# Altium schematic sheet push-button-switch-12.SchDoc
size A4; SheetNumber: 12; SheetTotal: 17
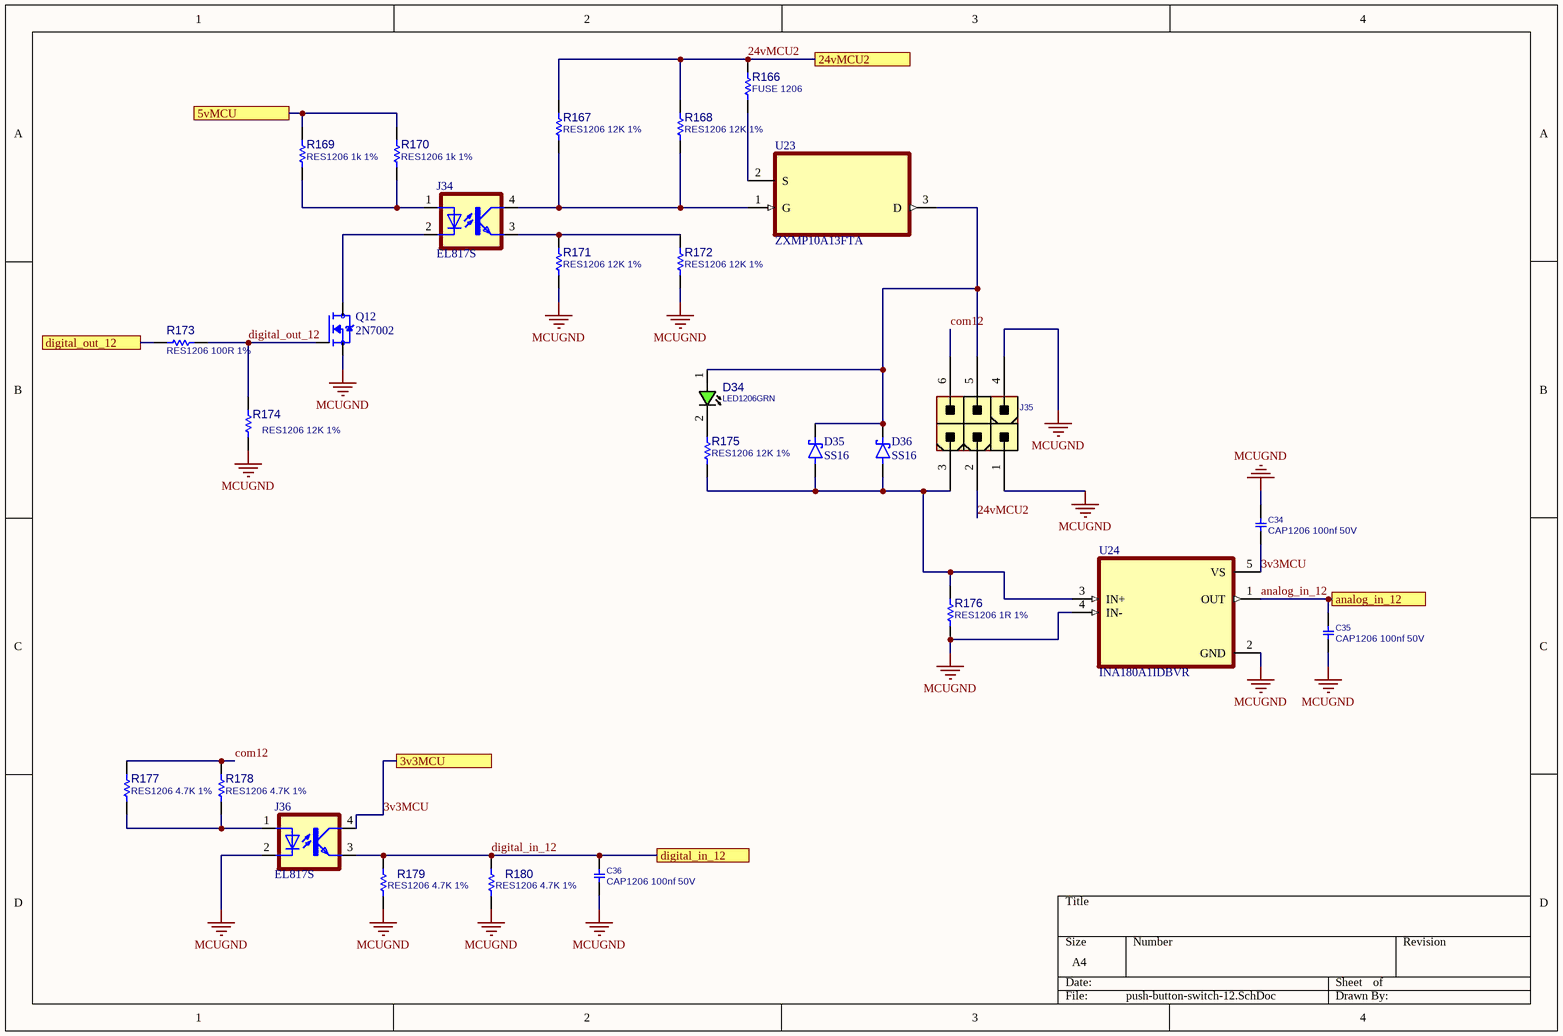
[diagram p0: push-button-switch-12.SchDoc]

## Parts
C34  CAP1206 100nf 50V  [C1206]
C35  CAP1206 100nf 50V  [C1206]
C36  CAP1206 100nf 50V  [C1206]
D34  LED1206GRN  [LED1206GRN]
D35  SS16  [DIOM4325X250N]
D36  SS16  [DIOM4325X250N]
J34  EL817S  [SOIC254P1030X460-4N]
J35  CONN_ATXPWR_6  [ATXPWR_6]  (value not drawn)
J36  EL817S  [SOIC254P1030X460-4N]
Q12  2N7002  [SOT95P240X111-3N]
R166  FUSE 1206  [R1206]
R167  RES1206 12K 1%  [R1206]
R168  RES1206 12K 1%  [R1206]
R169  RES1206 1k 1%  [R1206]
R170  RES1206 1k 1%  [R1206]
R171  RES1206 12K 1%  [R1206]
R172  RES1206 12K 1%  [R1206]
R173  RES1206 100R 1%  [R1206]
R174  RES1206 12K 1%  [R1206]
R175  RES1206 12K 1%  [R1206]
R176  RES1206 1R 1%  [R1206]
R177  RES1206 4.7K 1%  [R1206]
R178  RES1206 4.7K 1%  [R1206]
R179  RES1206 4.7K 1%  [R1206]
R180  RES1206 4.7K 1%  [R1206]
U23  ZXMP10A13FTA  [SOT95P230X110-3N]
U24  INA180A1IDBVR  [SOT95P280X145-5N]

## Ports
3v3MCU, 5vMCU, 24vMCU2, analog_in_12, digital_in_12, digital_out_12

## Nets
MCUGND: C34.1 C35.2 C36.2 J35.1 J35.4 J36.2(C) Q12.2(S) R171.2 R172.2 R174.2 R176.2 R179.1 R180.1 U24.2(GND) U24.4(IN-)
3v3MCU: C34.2 J36.4(COL) U24.5(VS) ; port 3v3MCU
5vMCU: R169.2 R170.2 ; port 5vMCU
24vMCU2: J35.2 R166.1 R167.1 R168.1 ; port 24vMCU2
analog_in_12: C35.1 U24.1(OUT) ; port analog_in_12
com12: J35.6 R177.2 R178.2
digital_in_12: C36.1 J36.3(EMIT) R179.2 R180.2 ; port digital_in_12
digital_out_12: Q12.1(G) R173.2 R174.1
digital_out_12: R173.1 ; port digital_out_12  [a separate net that carries the same name]
NetD34_1: D34.1(ANODE) D35.C(K) D36.C(K) J35.5 U23.3(D)
NetD34_2: D34.2(CATHODE) R175.1
NetD35_A: D35.A D36.A J35.3 R175.2 R176.1 U24.3(IN+)
NetJ34_1: J34.1(A) R169.1 R170.1
NetJ34_2: J34.2(C) Q12.3(D)
NetJ34_3: J34.3(EMIT) R171.1 R172.1
NetJ34_4: J34.4(COL) R167.2 R168.2 U23.1(G)
NetJ36_1: J36.1(A) R177.1 R178.1
NetR166_2: R166.2 U23.2(S)

## Library data of the parts
C34-C36 = CAP_SMD_MLCC_1206: CAP, MLCC; PARAM: -, -%; MANF_P#: MANF_PART#; PARAM2: -V; PRICE: 100= 1$; MANF: -; ASSEMBLY: ASSEMBLY
D34 = LED_SMD_1206_GRN: LED, SMD, 1206, GREEN; PARAM: 20mA; DESC: DESCRIPTION; PARAM2: 2.2V; MANF: -; ASSEMBLY: ASSEMBLY; PRICE: 36t@Javan; MANF_P#: -; VALUE: LED1206GRN; MountType: SMT; PartType: LED
D35 D36 = SS14: 1A, 40V, Schottky Rectifier; MF: Taiwan Semiconductor; SnapEDA_Link: https://www.snapeda.com/parts/SS14/taiwan/view-part/?ref=snap; Package: SMA-2 Taiwan Semiconductor; Value: *; MP: SS14; Check_prices: https://www.snapeda.com/parts/SS14/taiwan/view-part/?ref=eda
J34 J36 = EL817S: Optoisolator Transistor Output 5000Vrms 1 Channel 4-SMD; MF: Everlight Electronics; SnapEDA_Link: https://www.snapeda.com/parts/EL817S/Everlight+Electronics+Co+Ltd/view-part/?ref=snap; Package: SMD-4 Everlight Electronics Co Ltd; Value: *; MP: EL817S; Check_prices: https://www.snapeda.com/parts/EL817S/Everlight+Electronics+Co+Ltd/view-part/?ref=eda
J35 = CONN_ATXPWR_6: CONN, ATX POWER, 6 P; MANF: TE; MANF_P#: 4-1775099-1; VALUE: CONN_ATXPWR_6; MountType: THD; PACKAGE: ATXPWR-6pin; Part Type: Conn.
Q12 = 2N7002: N-Channel 60V 280mA (Ta) 350mW (Ta) Surface Mount SOT-23-3 (TO-236); MF: {'manufacturer': u'onsemi'}; Package: None; Price: None; Value: *; MP: 2N7002; Availability: Unavailable
R166-R180 = RES_SMD_1206: RESISTOR, SMD; PARAM: 1%, 0.25W; DESC: DESCRIPTION; DIST#: MOUSER; MANF_P#: -; MANF: -; ASSEMBLY: ASSEMBLY; PRICE: -; PARAM2: -
U23 = ZXMP10A13FTA: P-Channel 100 V 600mA (Ta) 625mW (Ta) Surface Mount SOT-23-3; MF: Diodes Inc.; Purchase-URL: https://pricing.snapeda.com/search/part/ZXMP10A13FTA/?ref=eda; Package: SOT-23-3 Diodes Inc.; SnapEDA_Link: https://www.snapeda.com/parts/ZXMP10A13FTA/Diodes+Inc./view-part/?ref=snap; Availability: In Stock; Value: *; MP: ZXMP10A13FTA; Check_prices: https://www.snapeda.com/parts/ZXMP10A13FTA/Diodes+Inc./view-part/?ref=eda; Price: None
U24 = INA180A1IDBVR: 26V, 350kHz current sense amplifier; MF: Texas Instruments; SnapEDA_Link: https://www.snapeda.com/parts/INA180A1IDBVR/Texas+Instruments/view-part/?ref=snap; Package: SOT-23-5 Texas Instruments; Value: *; MP: INA180A1IDBVR; Check_prices: https://www.snapeda.com/parts/INA180A1IDBVR/Texas+Instruments/view-part/?ref=eda